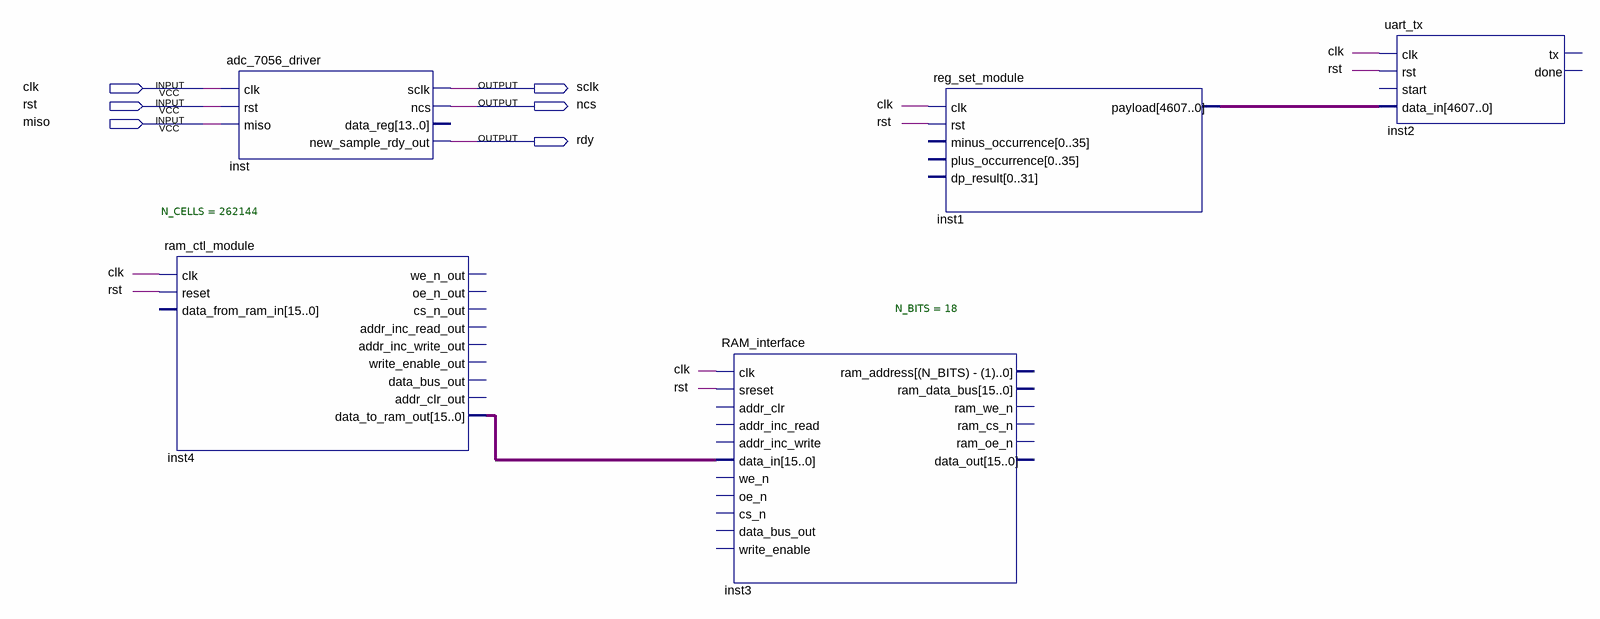
[diagram p0: schematic sheet]
// Quartus schematic FPGA_DP.bdf as structural Verilog: 5 symbols, 6 pins
module FPGA_DP (
  input  clk,
  input  rst,
  input  miso,
  output sclk,
  output ncs,
  output rdy
);

  wire inst1_payload_4607__0_;
  wire [15:0] inst4_data_to_ram_out;

  ram_ctl_module #(.N_CELLS(262144)) inst4 (
    .clk(clk), .reset(rst), .data_to_ram_out(inst4_data_to_ram_out));  // open: data_from_ram_in, we_n_out, oe_n_out, cs_n_out, addr_inc_read_out, addr_inc_write_out, write_enable_out, data_bus_out, addr_clr_out
  adc_7056_driver inst (
    .clk(clk), .rst(rst), .miso(miso), .sclk(sclk), .ncs(ncs), .new_sample_rdy_out(rdy));  // open: data_reg
  RAM_interface #(.N_BITS(18)) inst3 (
    .clk(clk), .sreset(rst), .data_in(inst4_data_to_ram_out));  // open: addr_clr, addr_inc_read, addr_inc_write, we_n, oe_n, cs_n, data_bus_out, write_enable, ram_address, ram_we_n, ram_cs_n, ram_oe_n, data_out, ram_data_bus
  reg_set_module inst1 (
    .clk(clk), .rst(rst), .\payload[4607..0] (inst1_payload_4607__0_));  // open: minus_occurrence, plus_occurrence, dp_result
  uart_tx inst2 (.clk(clk), .rst(rst), .\data_in[4607..0] (inst1_payload_4607__0_));  // open: start, tx, done
endmodule
